# Altium schematic sheet Power.SchDoc
size A4; SheetNumber: 2; SheetTotal: 5
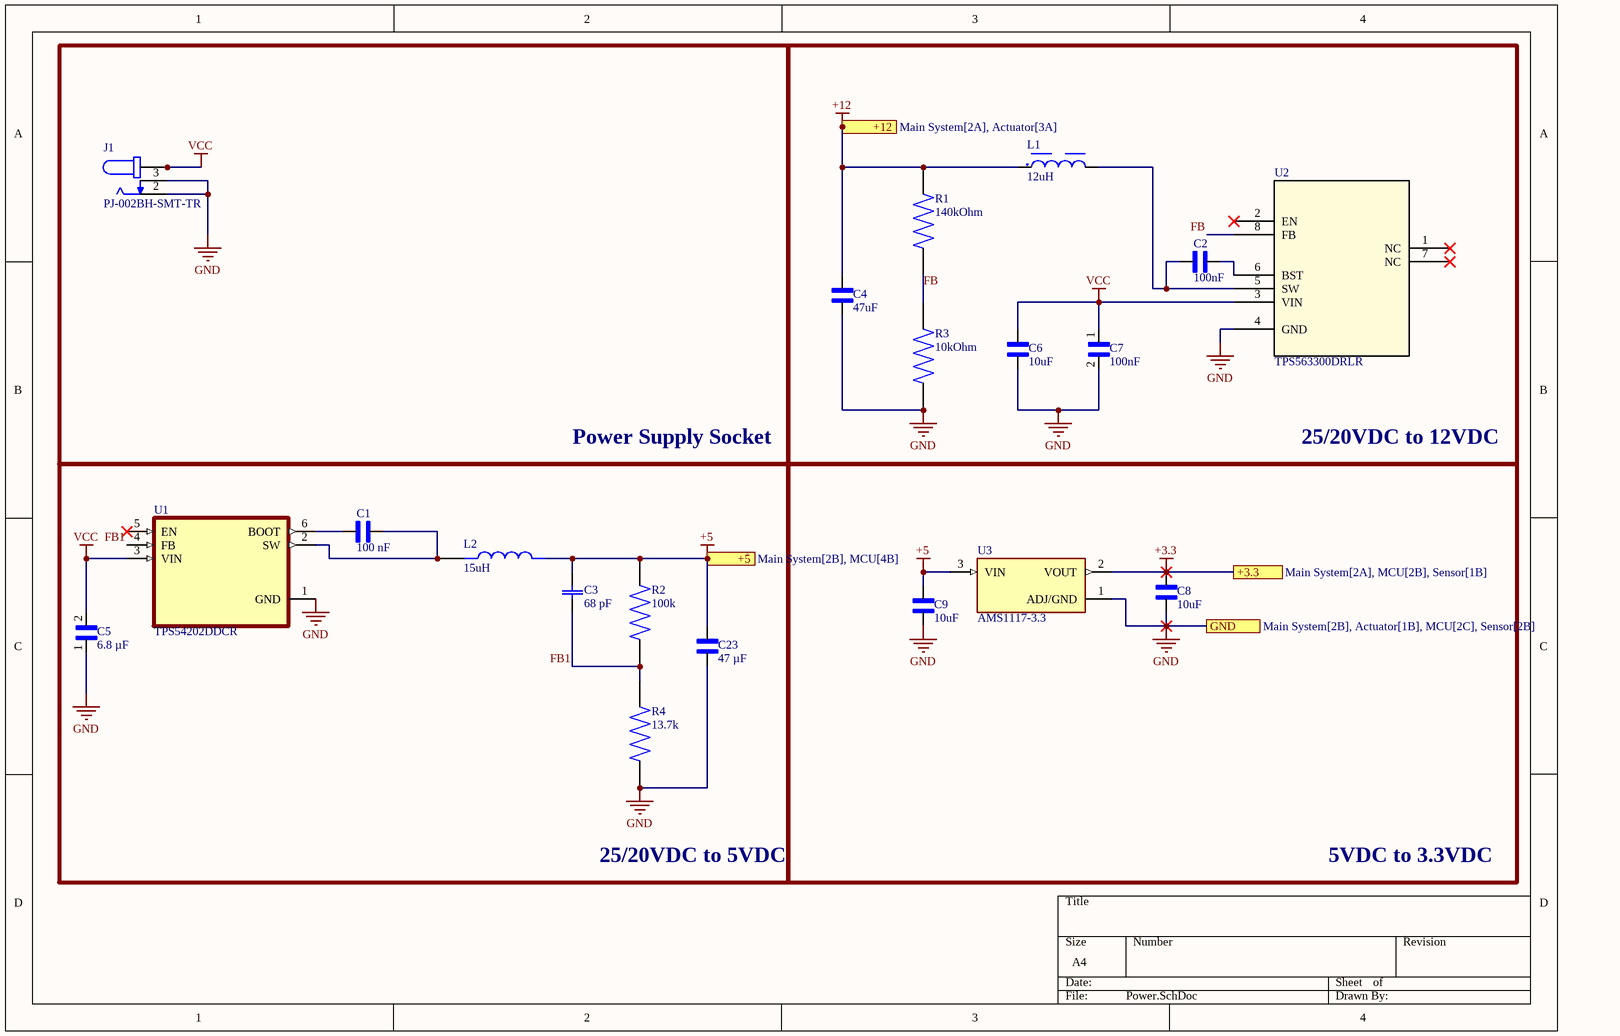
[diagram p0: Power.SchDoc]

## Parts
C1  100 nF  [CAPC2012X88N]
C2  100nF  [CAPC1005X55N]
C3  68 pF  [CAPC2013X88N]
C4  47uF  [CAPC3225X270N]
C5  6.8 µF  [CAPC2012X145N]
C6  10uF  [CAPC3225X270N]
C7  100nF  [CAPC1608X90N]
C8  10uF  [CAPC3225X270N]
C9  10uF  [CAPC3225X270N]
C23  47 µF  [CAPC3225X270N]
J1  PJ-002BH-SMT-TR  [CUI_PJ-002BH-SMT-TR]
L1  12uH  [WE-PD2_5848]
L2  15uH  [IND_CLF6045T-150M-D]
R1  140kOhm  [RESC1508X50N]
R2  100k  [RESC1508X50N]
R3  10kOhm  [RESC1005X40N]
R4  13.7k  [RESC1508X50N]
U1  TPS54202DDCR  [SOT95P280X110-6N]
U2  TPS563300DRLR  [SOT5X3-8_DRL_TEX]
U3  AMS1117-3.3  [SOT229P700X180-4N]

## Blocks framed on the sheet
Power Supply Socket: J1
25/20VDC to 12VDC: C2 C4 C6 C7 L1 R1 R3 U2
25/20VDC to 5VDC: C1 C3 C5 C23 L2 R2 R4 U1
5VDC to 3.3VDC: C8 C9 U3

## Ports
+3.3 (see Main System[2A], MCU[2B], Sensor[1B]), +5 (see Main System[2B], MCU[4B]), +12 (see Main System[2A], Actuator[3A]), GND (see Main System[2B], Actuator[1B], MCU[2C], Sensor[2B])

## Nets
+3.3: C8.2 U3.2(VOUT) ; port +3.3
+5: C3.2(C2) C9.2 C23.1 L2.2 R2.2 U3.3(VIN) ; port +5
+12: C4.1 L1.1 R1.2 ; port +12
GND: C4.2 C5.1 C6.1 C7.2 C8.1 C9.1 C23.2 J1.2 J1.3 R3.1 R4.1 U1.1(GND) U2.4(GND) U3.1(ADJ/GND) ; port GND
VCC: C5.2 C6.2 C7.1 J1.1A J1.1B U1.3(VIN) U2.3(VIN)
FB: R1.1 R3.2 U2.8(FB)
FB1: C3.1(C1) R2.1 R4.2 U1.4(FB)
NetC1_1: C1.1 U1.6(BOOT)
NetC1_2: C1.2 L2.1 U1.2(SW)
NetC2_1: C2.1 L1.2 U2.5(SW)
NetC2_2: C2.2 U2.6(BST)

Not connected (* = marked no-connect by the designer): U1 5(EN)*; U2 1(NC)* 2(EN)* 7(NC)*

## Library data of the parts
C1 = C0805C104M5RACTU: 0.1 ÂµF Â±20% 50V Ceramic Capacitor X7R 0805 (2012 Metric); MF: Kemet; MP: C0805C104M5RAC-TU; SnapEDA_Link: https://www.snapeda.com/parts/C0805C104M5RAC-TU/Kemet/view-part/?ref=snap; Package: Package; Value: *; Check_prices: https://www.snapeda.com/parts/C0805C104M5RAC-TU/Kemet/view-part/?ref=eda
C2 = GRM155R71A104KA01D: GRM155R71A104KA01D Cap C eramic 0.1uF 10VDC X7R 10 % SMD 0402 Paper T/R RoHS; MF: Murata; SnapEDA_Link: https://www.snapeda.com/parts/GRM155R71A104KA01D/Murata/view-part/?ref=snap; Package: 1005-2 Murata; Value: *; MP: GRM155R71A104KA01D; Check_prices: https://www.snapeda.com/parts/GRM155R71A104KA01D/Murata/view-part/?ref=eda
C3 = C0805C680J5GACTU: Capacitor;Ceramic;Cap;68.0pF;Tol+5%;SMT;Vol-Rtg 50V;C0G | KEMET C0805C680J5GACTU; SnapEDA_Link: https://www.snapeda.com/parts/C0805C680J5GACTU/KEMET/view-part/?ref=snap; Package: 0805 Kemet; Value: *; MF: KEMET; MP: C0805C680J5GACTU; Check_prices: https://www.snapeda.com/parts/C0805C680J5GACTU/KEMET/view-part/?ref=eda
C4 C23 = GRM32ER61C476KE15L: SMD Capacitor X5R(EIA) with Capacitance: 47uF Tol. 10%. Rated Voltage: 16Vdc; MF: Murata Electronics; SnapEDA_Link: https://www.snapeda.com/parts/GRM32ER61C476KE15L/Murata+Electronics+North+America/view-part/?ref=snap; Package: 3225 Murata; Value: *; MP: GRM32ER61C476KE15L; Check_prices: https://www.snapeda.com/parts/GRM32ER61C476KE15L/Murata+Electronics+North+America/view-part/?ref=eda
C5 = C2012X5R1V685K125AC: 6.8Î¼F Â±10% 35V é™¶ç“·ç”µå®¹å™¨ X5R 0805ï¼ˆ2012 å…¬åˆ¶ï¼‰; MF: TDK; Check_prices: https://www.snapeda.com/parts/C2012X5R1V685K125AC/TDK-Lambda+Americas+Inc/view-part/?ref=eda; Purchase-URL: https://pricing.snapeda.com/search/part/C2012X5R1V685K125AC/?ref=eda; Price: None; Availability: In Stock; Package: 2012 TDK; SnapEDA_Link: https://www.snapeda.com/parts/C2012X5R1V685K125AC/TDK-Lambda+Americas+Inc/view-part/?ref=snap; Value: *; MP: C2012X5R1V685K125AC
C6 = MSASU32MSB5106KPNA01: 10uF 50V 10% Multilayer Ceramic Capacitor X5R 1210 (3225 Metric); MF: Taiyo Yuden; SnapEDA_Link: https://www.snapeda.com/parts/MSASU32MSB5106KPNA01/Taiyo+Yuden/view-part/?ref=snap; Package: 3225-2 TAIYO; Value: *; MP: MSASU32MSB5106KPNA01; Check_prices: https://www.snapeda.com/parts/MSASU32MSB5106KPNA01/Taiyo+Yuden/view-part/?ref=eda
C7 = CGA3E2X7R1H104K080AA: 0.1ÂµF Â±10% 50V Ceramic Capacitor X7R 0603 (1608 Metric); MF: TDK; SnapEDA_Link: https://www.snapeda.com/parts/CGA3E2X7R1H104K080AA/TDK-Lambda+Americas+Inc/view-part/?ref=snap; Package: 1608 TDK; Value: *; MP: CGA3E2X7R1H104K080AA; Check_prices: https://www.snapeda.com/parts/CGA3E2X7R1H104K080AA/TDK-Lambda+Americas+Inc/view-part/?ref=eda; Purchase-URL: https://pricing.snapeda.com/search/part/CGA3E2X7R1H104K080AA/?ref=eda
C8 C9 = MSASU32MSB5106KPNA01: Cap = 10 µF / Total Derated Cap = 3.5 µF / VDC = 25 V / ESR = 5.85 mΩ / Package = 0805; MF: Taiyo Yuden; SnapEDA_Link: https://www.snapeda.com/parts/MSASU32MSB5106KPNA01/Taiyo+Yuden/view-part/?ref=snap; Package: 3225-2 TAIYO; Value: *; MP: MSASU32MSB5106KPNA01; Check_prices: https://www.snapeda.com/parts/MSASU32MSB5106KPNA01/Taiyo+Yuden/view-part/?ref=eda
J1 = PJ-002BH-SMT-TR: 2.5 x 6.5 mm, 5.0 A, Horizontal, Surface Mount (SMT), Dc Power Jack Connector; MF: Same Sky; SnapEDA_Link: https://www.snapeda.com/parts/PJ-002BH-SMT-TR/Same+Sky/view-part/?ref=snap; Package: None; Value: *; MP: PJ-002BH-SMT-TR; Check_prices: https://www.snapeda.com/parts/PJ-002BH-SMT-TR/Same+Sky/view-part/?ref=eda
L1 = WE-PD2_5848: FIXED IND 12UH 2A 110 MOHM SMD; MF: WÃ¼rth Elektronik; MP: 744774112; SnapEDA_Link: https://www.snapeda.com/parts/744774112/W%25C3%25BCrth+Elektronik+Midcom/view-part/?ref=snap; Package: Nonstandard WÃ¼rth Elektronik; Value: *; Check_prices: https://www.snapeda.com/parts/744774112/W%25C3%25BCrth+Elektronik+Midcom/view-part/?ref=eda
L2 = CLF6045T-150M-D: Ind Power Shielded Wirewound 15uH 20% 100KHz Ferrite 2A Blister Plastic T/R; MF: TDK; Availability: In Stock; Check_prices: https://www.snapeda.com/parts/CLF6045T-150M-D/TDK/view-part/?ref=eda; Value: *; Package: NON STANDARD-2 TDK; MP: CLF6045T-150M-D; Price: None; Purchase-URL: https://pricing.snapeda.com/search/part/CLF6045T-150M-D/?ref=eda; SnapEDA_Link: https://www.snapeda.com/parts/CLF6045T-150M-D/TDK/view-part/?ref=snap
R1 R2 R4 = CRCW0603140KFKEA: 140 kOhms Â±1% 0.1W, 1/10W Chip Resistor 0603 (1608 Metric) Automotive AEC-Q200 Thick Film; MF: Vishay Dale; SnapEDA_Link: https://www.snapeda.com/parts/CRCW0603140KFKEA/Dale/view-part/?ref=snap; Package: Package; Value: *; MP: CRCW0603140KFKEA; Check_prices: https://www.snapeda.com/parts/CRCW0603140KFKEA/Dale/view-part/?ref=eda
R3 = CRCW040210K0FKED: Resistor;Thick Film;10 Kilohms;0.063 W;1%;SMT;0402;TCR 37 ppm/DegC;Tape and Reel | Vishay Dale CRCW040210K0FKED; SnapEDA_Link: https://www.snapeda.com/parts/CRCW040210K0FKED/Dale/view-part/?ref=snap; Package: Package; Value: *; MF: Vishay Dale; MP: CRCW040210K0FKED; Check_prices: https://www.snapeda.com/parts/CRCW040210K0FKED/Dale/view-part/?ref=eda
U1 = TPS54202DDCR: 4.5V to 28V Input, 2A Output, EMI Friendly Synchronous Step-Down Converter; MF: Texas Instruments; SnapEDA_Link: https://www.snapeda.com/parts/TPS54202DDCR/Texas+Instruments/view-part/?ref=snap; Package: SOT-23-THN-6 Texas Instruments; Value: *; MP: TPS54202DDCR; Check_prices: https://www.snapeda.com/parts/TPS54202DDCR/Texas+Instruments/view-part/?ref=eda
U2 = TPS563300DRLR: 3.8-V to 28-V Input, 3-A synchronous buck converter in SOT-583 package 8-SOT-5X3 -40 to 150; Manufacturer_Name: Texas Instruments; Copyright: Copyright (C) 2026 Ultra Librarian. All rights reserved.; Manufacturer_Part_Number: TPS563300DRLR; RefDes: RefDes; Type: Type
U3 = AMS1117-3.3: Linear Voltage Regulator IC Positive Fixed 1 Output 1A SOT-223-3L; MF: UMW; SnapEDA_Link: https://www.snapeda.com/parts/AMS1117-3.3/UMW/view-part/?ref=snap; Package: SOT-223-3L UMW; Value: *; MP: AMS1117-3.3; Check_prices: https://www.snapeda.com/parts/AMS1117-3.3/UMW/view-part/?ref=eda